# EAGLE design proiect (EAGLE 9.6.2)
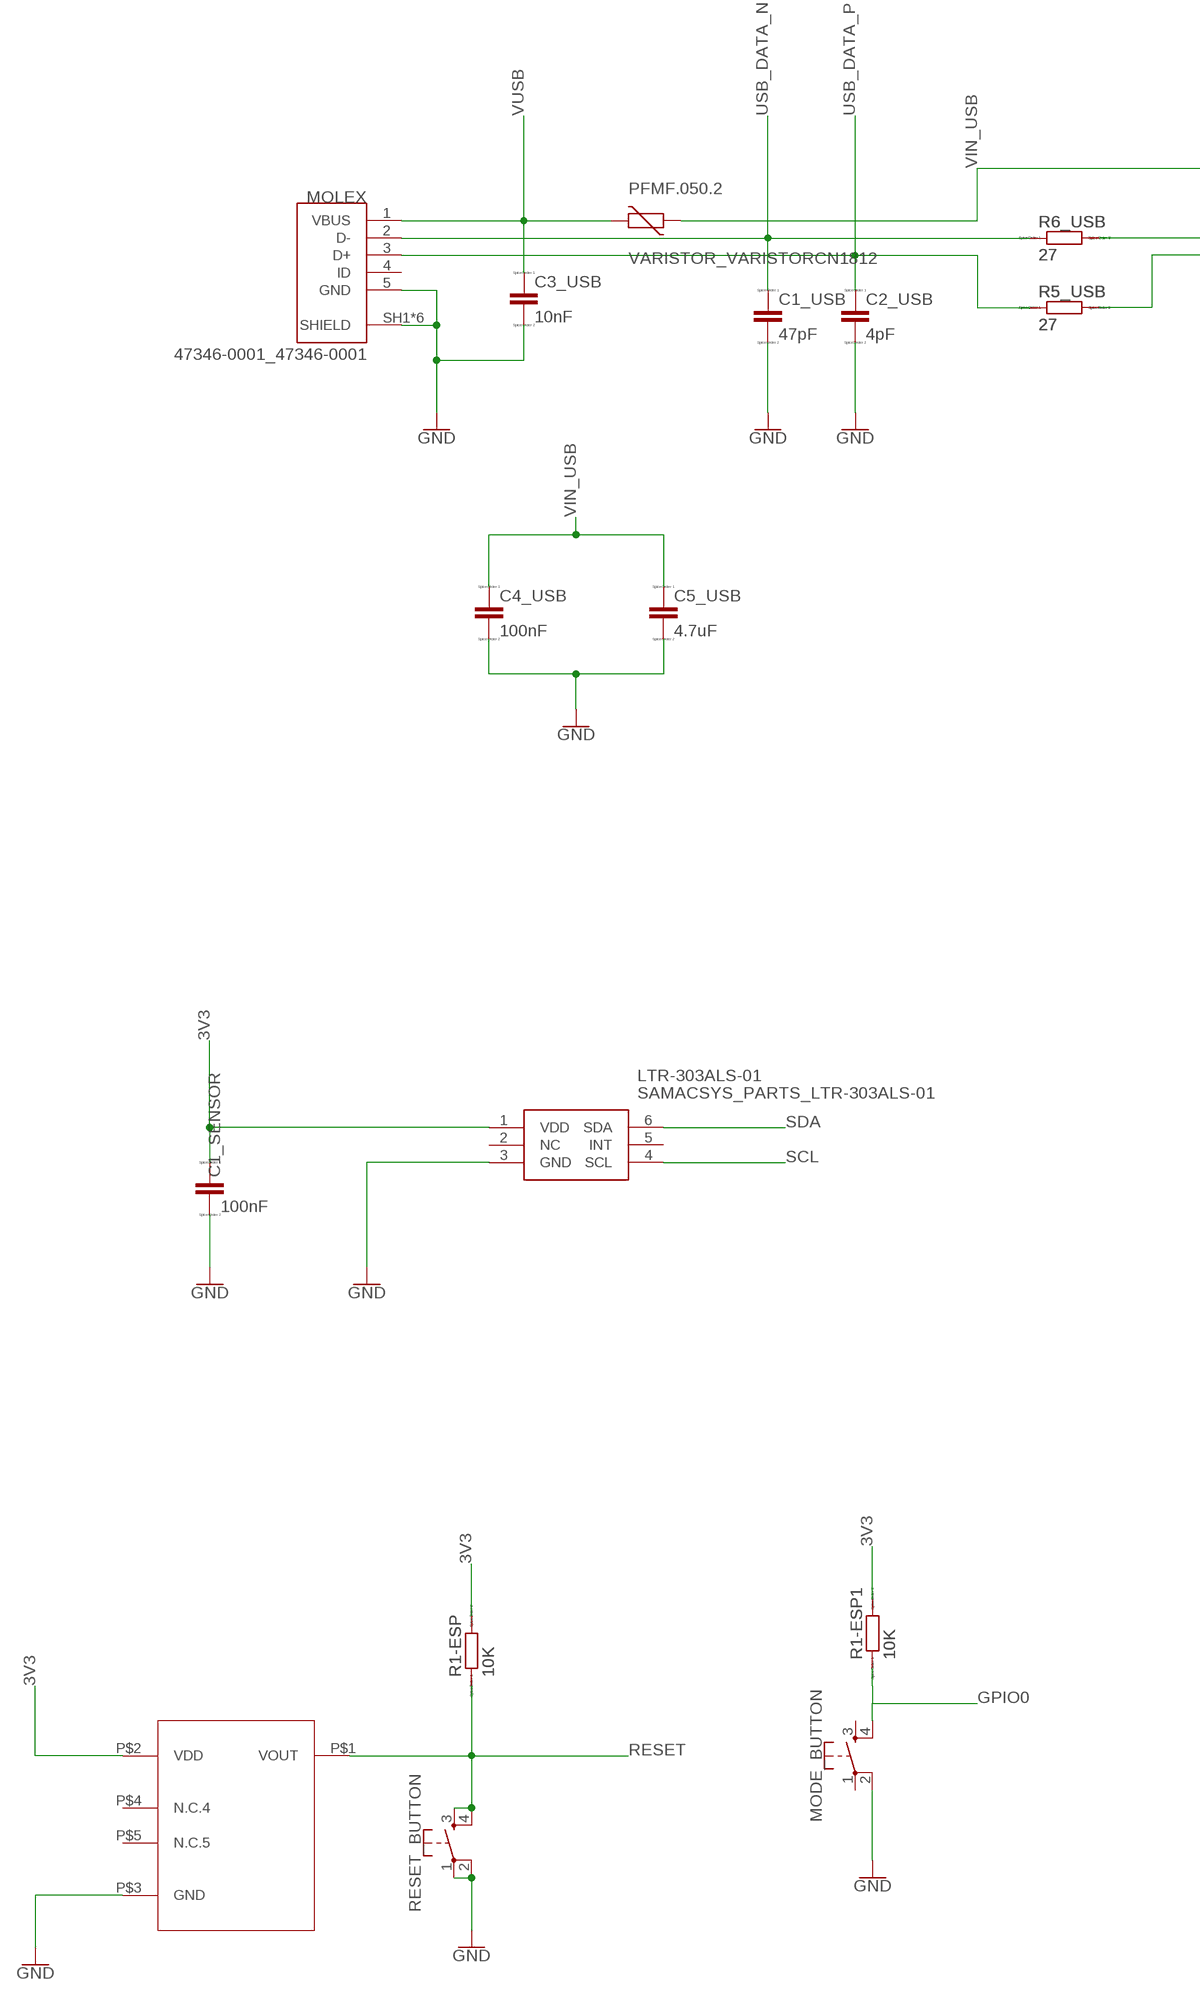
[diagram p0: schematic, sheet 1, part 1 of 2]
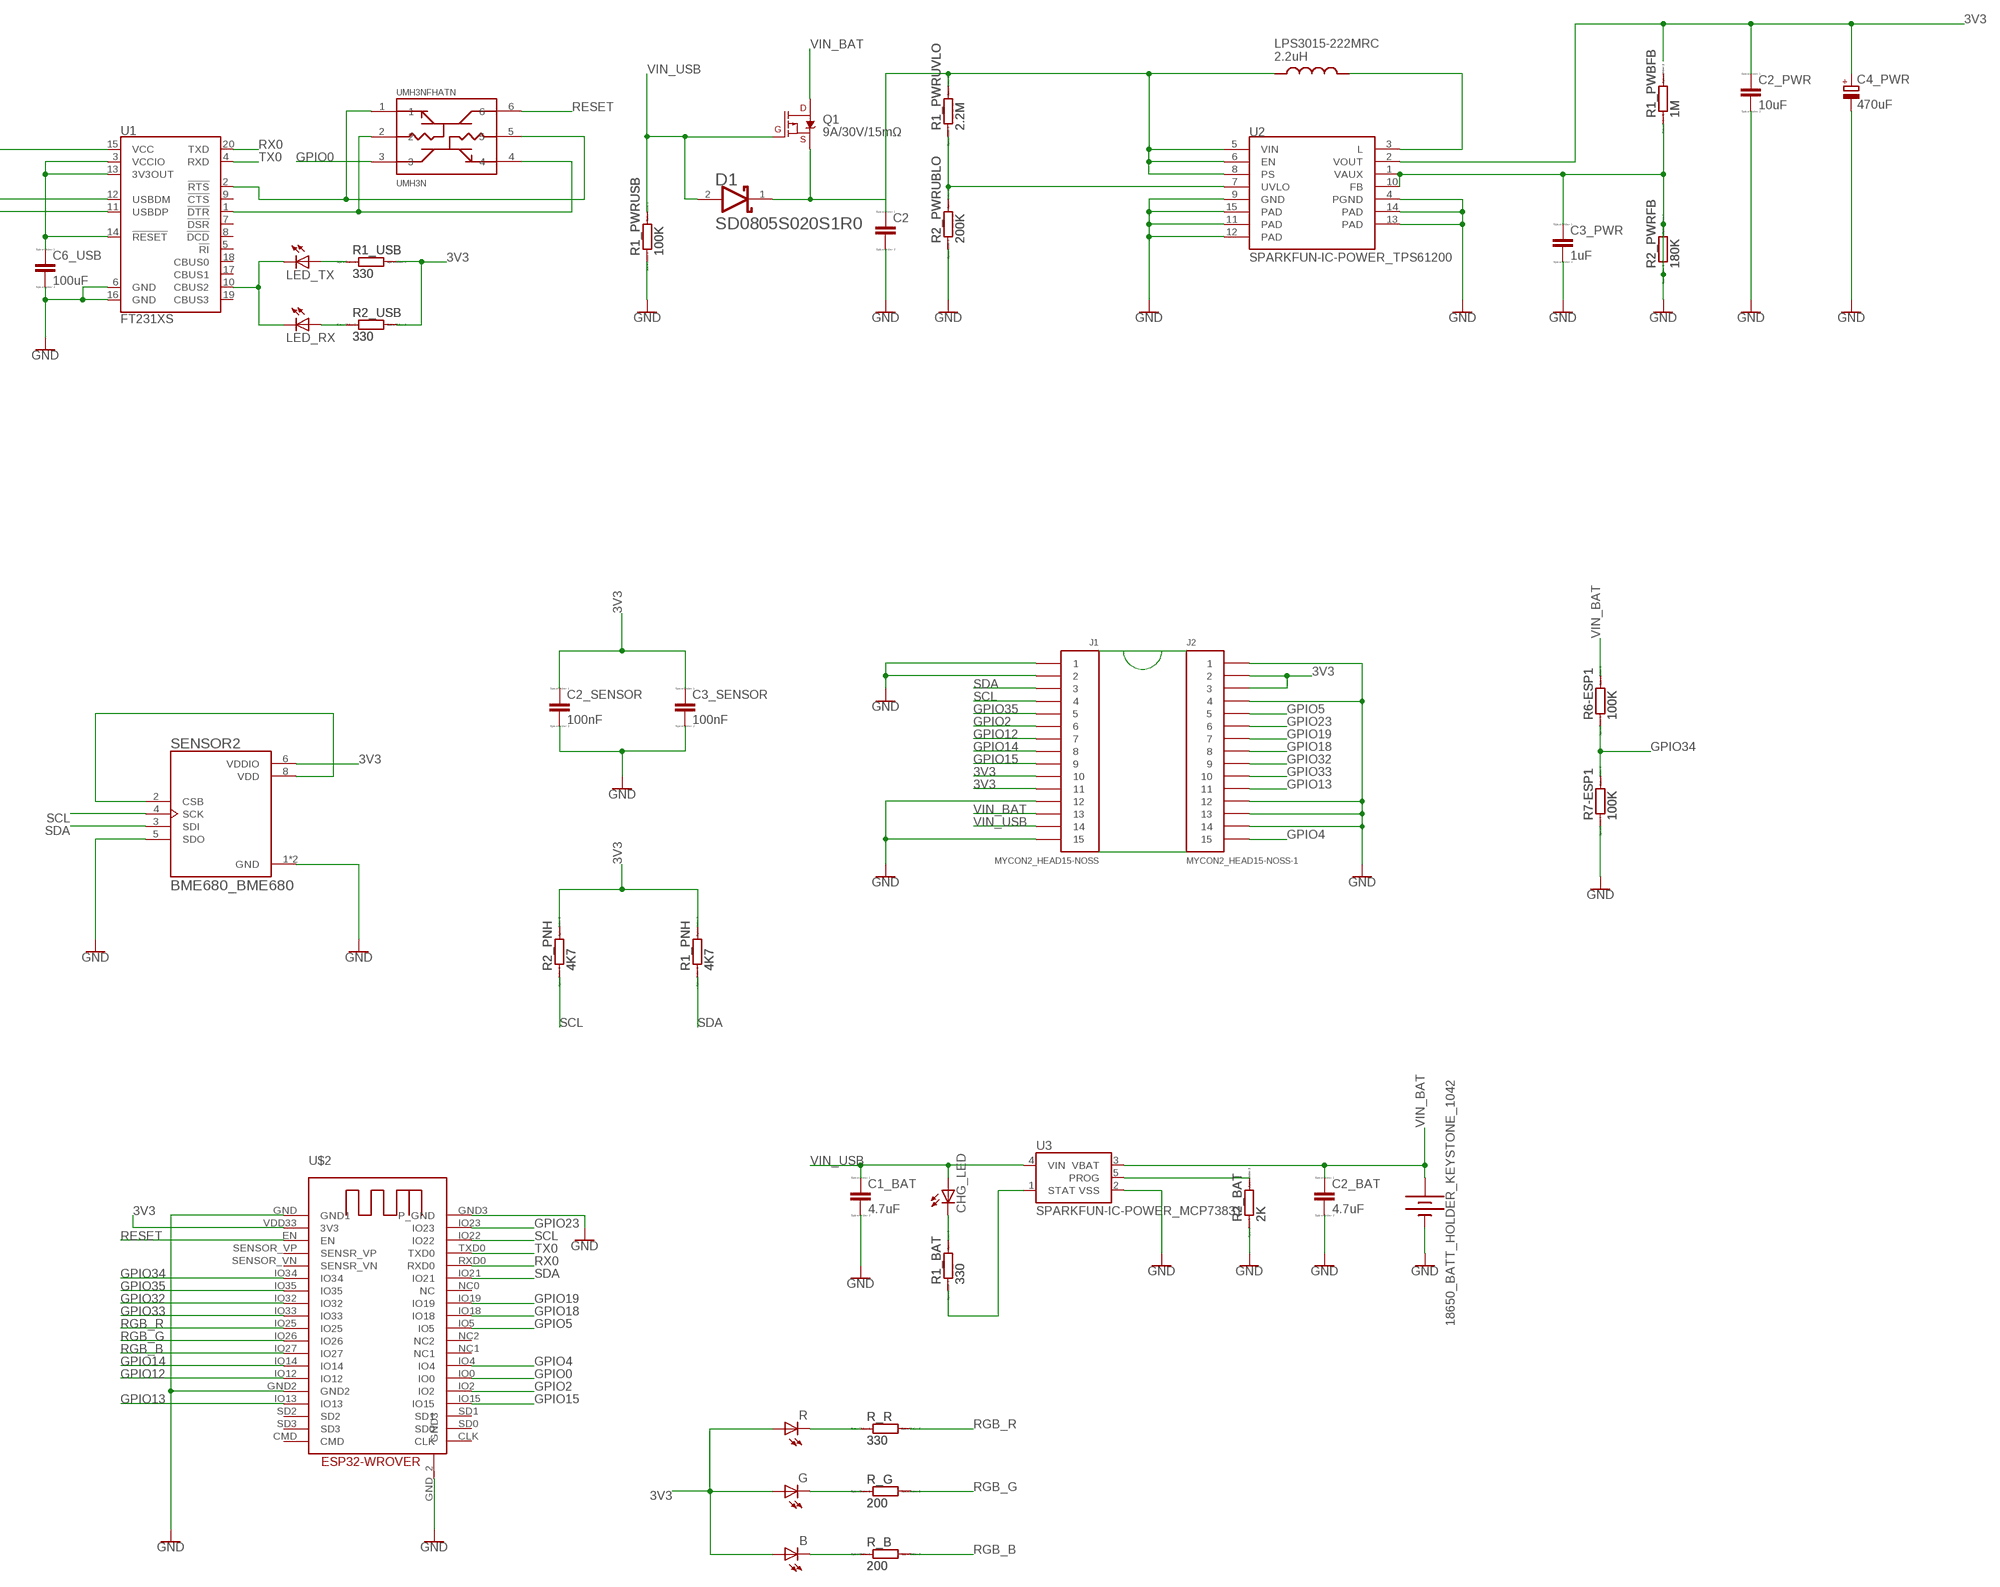
[diagram p1: schematic, sheet 1, part 2 of 2]

## Parts
18650_BATT_HOLDER_KEYSTONE_1042  BATTERY-18650  [BATTERY_18650-HOLDER]
B  ADAFRUIT_LEDCHIP-LED0603  [ADAFRUIT_CHIP-LED0603]
C1_BAT  4.7uF  EAGLE-LTSPICE_CC0402  [EAGLE-LTSPICE_C0402]
C1_SENSOR  100nF  EAGLE-LTSPICE_CC0402  [EAGLE-LTSPICE_C0402]
C1_USB  47pF  EAGLE-LTSPICE_CC0402  [EAGLE-LTSPICE_C0402]
C2  EAGLE-LTSPICE_CC0402  [EAGLE-LTSPICE_C0402]
C2_BAT  4.7uF  EAGLE-LTSPICE_CC0402  [EAGLE-LTSPICE_C0402]
C2_PWR  10uF  EAGLE-LTSPICE_CC0402  [EAGLE-LTSPICE_C0402]
C2_SENSOR  100nF  EAGLE-LTSPICE_CC0402  [EAGLE-LTSPICE_C0402]
C2_USB  4pF  EAGLE-LTSPICE_CC0402  [EAGLE-LTSPICE_C0402]
C3_PWR  1uF  EAGLE-LTSPICE_CC0402  [EAGLE-LTSPICE_C0402]
C3_SENSOR  100nF  EAGLE-LTSPICE_CC0402  [EAGLE-LTSPICE_C0402]
C3_USB  10nF  EAGLE-LTSPICE_CC0402  [EAGLE-LTSPICE_C0402]
C4_PWR  470uF  RCL_CPOL-EUD/7343-31R  [RCL_D/7343-31R]
C4_USB  100nF  EAGLE-LTSPICE_CC0402  [EAGLE-LTSPICE_C0402]
C5_USB  4.7uF  EAGLE-LTSPICE_CC0402  [EAGLE-LTSPICE_C0402]
C6_USB  100uF  EAGLE-LTSPICE_CC0402  [EAGLE-LTSPICE_C0402]
CHG_LED  ADAFRUIT_LEDCHIP-LED0603  [ADAFRUIT_CHIP-LED0603]
D1  AVX---SD0805S020S1R0_AVX_SD0805S020S1R0AVX_SD0805S020S1R0_0_0  [AVX---SD0805S020S1R0_AVX_SD0805S020S1R0_0]
G  ADAFRUIT_LEDCHIP-LED0603  [ADAFRUIT_CHIP-LED0603]
J1  MYCON2_HEAD15-NOSS  [MYCON2_HEAD15-NOSS]
J2  MYCON2_HEAD15-NOSS-1  [MYCON2_HEAD15-NOSS-1]
LED_RX  ADAFRUIT_LEDCHIP-LED0603  [ADAFRUIT_CHIP-LED0603]
LED_TX  ADAFRUIT_LEDCHIP-LED0603  [ADAFRUIT_CHIP-LED0603]
LTR-303ALS-01  SAMACSYS_PARTS_LTR-303ALS-01  [SAMACSYS_PARTS_LTR303ALS01]
MODE_BUTTON  SPARKFUN-SWITCHES_MOMENTARY-SWITCH-SPST-2-SMD-4.6X2.8MM  [SPARKFUN-SWITCHES_TACTILE_SWITCH_SMD_4.6X2.8MM]
MOLEX  47346-0001_47346-0001  [47346-0001_MOLEX_47346-0001]
PFMF.050.2  VARISTOR_VARISTORCN1812  [VARISTOR_CT/CN1812]
Q1  9A/30V/15mΩ  SPARKFUN-DISCRETESEMI_MOSFET_PCH-SI2309DS  [SPARKFUN-DISCRETESEMI_SOT23-3]
R  ADAFRUIT_LEDCHIP-LED0603  [ADAFRUIT_CHIP-LED0603]
R1-ESP  10K  EAGLE-LTSPICE_RR0402  [EAGLE-LTSPICE_R0402]
R1-ESP1  10K  EAGLE-LTSPICE_RR0402  [EAGLE-LTSPICE_R0402]
R1_BAT  330  EAGLE-LTSPICE_RR0402  [EAGLE-LTSPICE_R0402]
R1_PNH  4K7  EAGLE-LTSPICE_RR0402  [EAGLE-LTSPICE_R0402]
R1_PWBFB  1M  EAGLE-LTSPICE_RR0402  [EAGLE-LTSPICE_R0402]
R1_PWRUSB  100K  EAGLE-LTSPICE_RR0402  [EAGLE-LTSPICE_R0402]
R1_PWRUVLO  2.2M  EAGLE-LTSPICE_RR0402  [EAGLE-LTSPICE_R0402]
R1_USB  330  EAGLE-LTSPICE_RR0402  [EAGLE-LTSPICE_R0402]
R2_BAT  2K  EAGLE-LTSPICE_RR0402  [EAGLE-LTSPICE_R0402]
R2_PNH  4K7  EAGLE-LTSPICE_RR0402  [EAGLE-LTSPICE_R0402]
R2_PWRFB  180K  EAGLE-LTSPICE_RR0402  [EAGLE-LTSPICE_R0402]
R2_PWRUBLO  200K  EAGLE-LTSPICE_RR0402  [EAGLE-LTSPICE_R0402]
R2_USB  330  EAGLE-LTSPICE_RR0402  [EAGLE-LTSPICE_R0402]
R5_USB  27  EAGLE-LTSPICE_RR0402  [EAGLE-LTSPICE_R0402]
R6-ESP1  100K  EAGLE-LTSPICE_RR0402  [EAGLE-LTSPICE_R0402]
R6_USB  27  EAGLE-LTSPICE_RR0402  [EAGLE-LTSPICE_R0402]
R7-ESP1  100K  EAGLE-LTSPICE_RR0402  [EAGLE-LTSPICE_R0402]
R_B  200  EAGLE-LTSPICE_RR0402  [EAGLE-LTSPICE_R0402]
R_G  200  EAGLE-LTSPICE_RR0402  [EAGLE-LTSPICE_R0402]
R_R  330  EAGLE-LTSPICE_RR0402  [EAGLE-LTSPICE_R0402]
RESET_BUTTON  SPARKFUN-SWITCHES_MOMENTARY-SWITCH-SPST-2-SMD-4.6X2.8MM  [SPARKFUN-SWITCHES_TACTILE_SWITCH_SMD_4.6X2.8MM]
SENSOR2  BME680_BME680  [BME680_PSON80P300X300X100-8N]
U1  FT231XS  [SSOP20_L]
U2  SPARKFUN-IC-POWER_TPS61200  [SPARKFUN-IC-POWER_QFN-10_PAD]
U3  SPARKFUN-IC-POWER_MCP73831  [SPARKFUN-IC-POWER_SOT23-5]
U$1  BD48E27G-TR_BD48E27G-TR  [BD48E27G-TR_SSOP5]
U$2  ESP32-WROVER_ESP32-WROVER  [ESP32-WROVER_ESP32-WROVER]
U$3  LPS3015_LPS3015  [LPS3015_LPS3015-222MRC]
UMH3NFHATN  UMH3N_UMH3N  [UMH3N_SOP65P210X100-6N]

## Nets
3V3: B.A C1_SENSOR.1 C2_PWR.1 C2_SENSOR.1 C3_SENSOR.1 C4_PWR.+ G.A J1.10 J1.11 J2.2 J2.3 LTR-303ALS-01.1(VDD) R1-ESP1.2 R1-ESP.2 R1_PNH.2 R1_USB.2 R2_PNH.2 R2_USB.2 R.A SENSOR2.6(VDDIO) U2.2(VOUT) U$1.P$2(VDD) U$2.VDD33(3V3)
GND: 18650_BATT_HOLDER_KEYSTONE_1042.GND@1(-) C1_BAT.2 C1_SENSOR.2 C1_USB.2 C2.2 C2_BAT.2 C2_PWR.2 C2_SENSOR.2 C2_USB.2 C3_PWR.1 C3_PWR.2 C3_SENSOR.2 C3_USB.2 C4_PWR.- C4_USB.2 C5_USB.2 C6_USB.2 J1.1 J1.2 J1.12 J1.15 J2.1 J2.4 J2.12 J2.13 J2.14 LTR-303ALS-01.3(GND) MODE_BUTTON.2 MOLEX.5(GND) MOLEX.SH1(SHIELD) MOLEX.SH2(SHIELD) MOLEX.SH3(SHIELD) MOLEX.SH4(SHIELD) MOLEX.SH5(SHIELD) MOLEX.SH6(SHIELD) R1_PWBFB.1 R1_PWRUSB.1 R2_BAT.1 R2_PWRFB.1 R2_PWRFB.2 R2_PWRUBLO.1 R7-ESP1.1 RESET_BUTTON.1 RESET_BUTTON.2 SENSOR2.1(GND) SENSOR2.5(SDO) SENSOR2.7(GND) U1.6(GND) U1.16(GND) U2.1(VAUX) U2.4(PGND) U2.9(GND) U2.10(FB) U2.11(PAD) U2.12(PAD) U2.13(PAD) U2.14(PAD) U2.15(PAD) U3.2(VSS) U$1.P$3(GND) U$2.GND2 U$2.GND3(P_GND) U$2.GND(GND1) U$2.GND_2(GND3)
GPIO0: MODE_BUTTON.4 R1-ESP1.1 U$2.IO0 UMH3NFHATN.3
GPIO2: J1.6 U$2.IO2
GPIO4: J2.15 U$2.IO4
GPIO5: J2.5 U$2.IO5
GPIO12: J1.7 U$2.IO12
GPIO13: J2.11 U$2.IO13
GPIO14: J1.8 U$2.IO14
GPIO15: J1.9 U$2.IO15
GPIO18: J2.8 U$2.IO18
GPIO19: J2.7 U$2.IO19
GPIO23: J2.6 U$2.IO23
GPIO32: J2.9 U$2.IO32
GPIO33: J2.10 U$2.IO33
GPIO34: R6-ESP1.1 R7-ESP1.2 U$2.IO34
GPIO35: J1.5 U$2.IO35
N$1: LED_RX.C LED_TX.C U1.10(CBUS2)
N$2: LED_RX.A R2_USB.1
N$3: U1.2(!RTS) UMH3NFHATN.1 UMH3NFHATN.5
N$4: LED_TX.A R1_USB.1
N$5: U1.1(!DTR) UMH3NFHATN.2 UMH3NFHATN.4
N$6: C6_USB.1 U1.3(VCCIO) U1.13(3V3OUT) U1.14(!RESET)
N$7: R6_USB.2 U1.12(USBDM)
N$8: R5_USB.2 U1.11(USBDP)
N$9: SENSOR2.2(CSB) SENSOR2.8(VDD)
N$10: U2.3(L) U$3.P$2
N$11: R1_PWRUVLO.1 R2_PWRUBLO.2 U2.7(UVLO)
N$14: R2_BAT.2 U3.5(PROG)
N$15: CHG_LED.C R1_BAT.2
N$16: R1_BAT.1 U3.1(STAT)
N$18: G.C R_G.1
N$20: R.C R_R.1
N$22: B.C R_B.1
RESET: R1-ESP.1 RESET_BUTTON.3 RESET_BUTTON.4 U$1.P$1(VOUT) U$2.EN UMH3NFHATN.6
RGB_B: R_B.2 U$2.IO27
RGB_G: R_G.2 U$2.IO26
RGB_R: R_R.2 U$2.IO25
RX0: U1.20(TXD) U$2.RXD0
SCL: J1.4 LTR-303ALS-01.4(SCL) R2_PNH.1 SENSOR2.4(SCK) U$2.IO22
SDA: J1.3 LTR-303ALS-01.6(SDA) R1_PNH.1 SENSOR2.3(SDI) U$2.IO21
TX0: U1.4(RXD) U$2.TXD0
USB_DATA_N: C1_USB.1 MOLEX.2(D-) R6_USB.1
USB_DATA_P: C2_USB.1 MOLEX.3(D+) R5_USB.1
VIN: C2.1 D1.1(CATHODE) Q1.2(S) R1_PWRUVLO.2 U2.5(VIN) U2.6(EN) U2.8(PS) U$3.P$1
VIN_BAT: 18650_BATT_HOLDER_KEYSTONE_1042.PWR@1(+) C2_BAT.1 J1.13 Q1.3(D) R6-ESP1.2 U3.3(VBAT)
VIN_USB: C1_BAT.1 C4_USB.1 C5_USB.1 CHG_LED.A D1.2(ANODE) J1.14 PFMF.050.2.1 Q1.1(G) R1_PWRUSB.2 U1.15(VCC) U3.4(VIN)
VUSB: C3_USB.1 MOLEX.1(VBUS) PFMF.050.2.2
Unconnected: LTR-303ALS-01.2(NC) LTR-303ALS-01.5(INT) MODE_BUTTON.1 MODE_BUTTON.3 MOLEX.4(ID) R1_PWBFB.2 U1.5(!RI) U1.7(!DSR) U1.8(!DCD) U1.9(!CTS) U1.17(CBUS1) U1.18(CBUS0) U1.19(CBUS3) U$1.P$4(N.C.4) U$1.P$5(N.C.5) U$2.CLK U$2.CMD U$2.NC0(NC) U$2.NC1 U$2.NC2 U$2.SD0 U$2.SD1 U$2.SD2 U$2.SD3 U$2.SENSOR_VN(SENSR_VN) U$2.SENSOR_VP(SENSR_VP)

## Library data of the parts
18650_BATT_HOLDER_KEYSTONE_1042 = SparkFun-Batteries:BATTERY: Battery - Single Cell A variety of battery chemistries, sizes, and footprints. Device List: 20MM_PTH - Coin Cell Battery Holder - 20mm (PTH) <https://www.sparkfun.com/products/783> 6.8MM_PTH - Coin Cell Battery Holder - 6.8MM(SMD) <https://www.digikey.com/product-detail/en/seiko-instruments/MS621FE-FL11E/728-1057-ND/1889208?WT.srch=1&gclid=CNOQ5a6LzdQCFZS2wAodXCkE0g> 12MM_SMD - Coin Cell Battery Holder - 12mm (SMD) <https://www.sparkfun.com/products/10592> 12MM_PTH - Coin Cell Battery Holder - 12mm (PTH) <https://www.sparkfun.com/products/7948> 20MM_SMD - 20mm Coin Cell Battery Holder (SMD) (2 legs) Used on the Big Time Watch Kit <https://www.sparkfun.com/products/11734> 20MM_SMD_4LEGS - Coin Cell Battery Holder - 20mm (SMD) <https://www.sparkfun.com/products/11892> 20MM_SMD_4LEGS_OVERPASTE - Coin Cell Battery Holder - 20mm (SMD) <https://www.sparkfun.com/products/11892> (Over-paste on the legs) 24.5MM_PTH - Coin Cell Battery Holder - 24.5mm (PTH) <https://www.sparkfun.com/products/8863> 9V - 9V Battery Holder - PC Mount Used on the SparkFun SparkPunk Sound Kit <https://www.sparkfun.com/products/11177> and SparkFun SparkPunk Sequencer Kit <https://www.sparkfun.com/products/12707> 18650 - Battery Holder - 18650 (PTH) <https://www.sparkfun.com/products/13113> AA - Battery Holder - 1xAA (PTH) <https://www.sparkfun.com/products/7949> AAA - Battery Holder - 1xAAA (PTH) <https://www.sparkfun.com/products/12718> AA_KIT - Battery Holder - 1xAA (PTH) <https://www.sparkfun.com/products/7949> Special kit package - pads only have exposed copper on one side of the board. AAA_KIT - Battery Holder - 1xAAA (PTH) <https://www.sparkfun.com/products/12718> Special kit package - pads only have exposed copper on one side of the board.; PROD_ID: BATT-12327; SF_SKU: PRT-13113
B CHG_LED G LED_RX LED_TX R = ESP32_WROVER:ADAFRUIT_LED: LED OSRAM: - CHIPLED LG R971, LG N971, LY N971, LG Q971, LY Q971, LO R971, LY R971 LH N974, LH R974 LS Q976, LO Q976, LY Q976 LO Q996 - Hyper CHIPLED LW Q18S LB Q993, LB Q99A, LB R99A - SideLED LS A670, LO A670, LY A670, LG A670, LP A670 LB A673, LV A673, LT A673, LW A673 LH A674 LY A675 LS A676, LA A676, LO A676, LY A676, LW A676 LS A679, LY A679, LG A679 - Hyper Micro SIDELED® LS Y876, LA Y876, LO Y876, LY Y876 LT Y87S - SmartLED LW L88C, LW L88S LB L89C, LB L89S, LG L890 LS L89K, LO L89K, LY L89K LS L896, LA L896, LO L896, LY L896 - TOPLED LS T670, LO T670, LY T670, LG T670, LP T670 LSG T670, LSP T670, LSY T670, LOP T670, LYG T670 LG T671, LOG T671, LSG T671 LB T673, LV T673, LT T673, LW T673 LH T674 LS T676, LA T676, LO T676, LY T676, LB T676, LH T676, LSB T676, LW T676 LB T67C, LV T67C, LT T67C, LS T67K, LO T67K, LY T67K, LW E67C LS E67B, LA E67B, LO E67B, LY E67B, LB E67C, LV E67C, LT E67C LW T67C LS T679, LY T679, LG T679 LS T770, LO T770, LY T770, LG T770, LP T770 LB T773, LV T773, LT T773, LW T773 LH T774 LS E675, LA E675, LY E675, LS T675 LS T776, LA T776, LO T776, LY T776, LB T776 LHGB T686 LT T68C, LB T68C - Hyper Mini TOPLED® LB M676 - Mini TOPLED Santana® LG M470 LS M47K, LO M47K, LY M47K Source: http://www.osram.convergy.de/
C1_BAT C1_SENSOR C1_USB C2 C2_BAT C2_PWR C2_SENSOR C2_USB C3_PWR C3_SENSOR C3_USB C4_USB C5_USB C6_USB = ESP32_WROVER:EAGLE-LTSPICE_C: CAPACITOR, European symbol; SPICEMODEL: NONE; SPICEPREFIX: C
C4_PWR = ESP32_WROVER:RCL_CPOL-EU: POLARIZED CAPACITOR, European symbol; SPICEPREFIX: C
D1 = ESP32_WROVER:AVX---SD0805S020S1R0_AVX_SD0805S020S1R0: Schottky Barrier Rectifier Diode; CENTROID_NOT_SPECIFIED: No; DATASHEET: http://datasheets.avx.com/schottky.pdf; DIGIKEY_DESCRIPTION: DIODE SCHOTTKY 20V 1A 0805; DIGIKEY_PART_NUMBER: 478-7800-1-ND; LEAD_FREE: yes; MF: AVX; MOUSER_PART_NUMBER: 581-SD0805S020S1R0; MPN: SD0805S020S1R0; PACKAGE: 0805 (2012 metric); PREFIX: D; ROHS: yes; TEMPERATURE_RANGE_HIGH: +125°C; TEMPERATURE_RANGE_LOW: -55°C
J1 = ESP32_WROVER:MYCON2_HEAD15-NOSS
J2 = ESP32_WROVER:MYCON2_HEAD15-NOSS-1
LTR-303ALS-01 = ESP32_WROVER:SAMACSYS_PARTS_LTR-303ALS-01: Ambient Light Sensors Ambient Light Photo Sensor Source: Datasheet <http://optoelectronics.liteon.com/upload/download/DS86-2013-0004/LTR-303ALS-01_DS_V1.pdf>; ARROW_PART_NUMBER: LTR-303ALS-01; ARROW_PRICE-STOCK: https://www.arrow.com/en/products/ltr-303als-01/lite-on-technology?region=nac; DESCRIPTION: Ambient Light Sensors Ambient Light Photo Sensor; HEIGHT: 0mm; MANUFACTURER_NAME: Lite-On; MANUFACTURER_PART_NUMBER: LTR-303ALS-01; MOUSER_PART_NUMBER: 859-LTR-303ALS-01; MOUSER_PRICE-STOCK: https://www.mouser.co.uk/ProductDetail/Lite-On/LTR-303ALS-01?qs=Ml%2FaxAEbwm%252Bm%252BetMkBDC8g%3D%3D
MODE_BUTTON RESET_BUTTON = ESP32_WROVER:SPARKFUN-SWITCHES_MOMENTARY-SWITCH-SPST-2: Momentary Switch (Pushbutton) - SPST - Two Circuits Normally-open (NO) SPST momentary switches (buttons, pushbuttons). Schematic symbol includes two switch circuits. Variants SMD-4.6MMX2.8MM - 4.60mm x 2.80mm Tactile Momentary Button Switch - Used on SparkFun SAMD21 Mini Breakout <https://www.sparkfun.com/products/13664> SMD-5.2MM - Mini Pushbutton Switch - SMD <https://www.sparkfun.com/products/8720> - Used on Arduino Pro Mini <https://www.sparkfun.com/products/11114>; PROD_ID: SWCH-14139; SF_SKU: COM-08720
MOLEX = ESP32_WROVER:47346-0001_47346-0001: CONN RCPT 5POS MICRO USB R/A SMD Check prices <https://pricing.snapeda.com/parts/47346-0001/Molex/view-part?ref=eda>; AVAILABILITY: Warning; DESCRIPTION: USB - micro B USB 2.0 Receptacle Connector 5 Position Surface Mount, Right Angle; MF: Molex; MP: 47346-0001; PACKAGE: None; PRICE: None
PFMF.050.2 = ESP32_WROVER:VARISTOR_VARISTOR: VARISTOR
Q1 = ESP32_WROVER:SPARKFUN-DISCRETESEMI_MOSFET_PCH: P-channel MOSFETs Voltage controlled devices that allow control of high current outputs. SparkFun Products: SparkFun ESP32 Thing <https://www.sparkfun.com/products/13907> SparkFun ESP8266 Thing <https://www.sparkfun.com/products/13231> SparkFun Pi Servo HAT V2 <https://www.sparkfun.com/products/15316> DMG2305UX-7 (20V/4.2A/SOT23-3); PROD_ID: TRANS-14715
R1-ESP R1-ESP1 R1_BAT R1_PNH R1_PWBFB R1_PWRUSB R1_USB R2_BAT R2_PNH R2_PWRFB R2_USB R5_USB R6-ESP1 R6_USB R7-ESP1 R_B R_G R_R = ESP32_WROVER:EAGLE-LTSPICE_R: RESISTOR, European symbol; SPICEMODEL: NONE; SPICEPREFIX: R
R1_PWRUVLO R2_PWRUBLO = ESP32_WROVER:EAGLE-LTSPICE_R*?: RESISTOR, European symbol; SPICEMODEL: NONE; SPICEPREFIX: R
SENSOR2 = ESP32_WROVER:BME680_BME680: Integrated Environmental Unit; AVAILABILITY: Unavailable; DESCRIPTION: Integrated Environmental Unit; MF: Bosch Sensortec; MP: BME680; PACKAGE: LGA-8 Bosch Tools; PRICE: None
U1 = SparkFun-IC-Comms:FT231X: FTDI FT231X Full Speed USB to Full-handshake UART This USB2.0 Full Speed IC offers a compact bridge to full handshake UART interfaces. The device is a UART, capable of operating up to 3MBaud, with low power consumption (8mA). The FT231X includes the complete FT-X series feature set and enables USB to be added into a system design quickly and easily over a UART interface. Datasheet <http://cdn.sparkfun.com/datasheets/Components/General%20IC/DS_FT231X.pdf> SparkFun Products SparkFun RedBoard - Programmed with Arduino <https://www.sparkfun.com/products/12757> (DEV-12757) SparkFun XBee Explorer USB <https://www.sparkfun.com/products/11812> (WRL-11812) SparkFun XBee Explorer Dongle <https://www.sparkfun.com/products/11697> (WRL-11697) SparkFun Blynk Board - ESP8266 <https://www.sparkfun.com/products/13794> (WRL-13794) SparkFun ESP8266 Thing - Dev Board <https://www.sparkfun.com/products/13711> (WRL-13711) SparkFun Block for Intel® Edison - Base <https://www.sparkfun.com/products/13045> (DEV-13045) SparkFun RedStick <https://www.sparkfun.com/products/13741> (DEV-13741) SparkFun Beefy 3 - FTDI Basic Breakout <https://www.sparkfun.com/products/13746> (DEV-13746) SparkFun FT231X Breakout <https://www.sparkfun.com/products/11736> (BOB-11736); PROD_ID: IC-11524
U2 = ESP32_WROVER:SPARKFUN-IC-POWER_TPS61200: DC to DC Booster IC-10035; PROD_ID: IC-10035
U3 = ESP32_WROVER:SPARKFUN-IC-POWER_MCP73831: MCP73831T Li-Ion, Li-Pol Controller Miniature single cell, fully integrated Li-Ion, Li-polymer charge management controller Datasheet <http://ww1.microchip.com/downloads/en/DeviceDoc/20001984g.pdf> SparkFun Products: SparkFun ESP32 Thing <https://www.sparkfun.com/products/13907> SparkFun 9DoF Razor IMU M0 <https://www.sparkfun.com/products/14001>; PROD_ID: IC-09995
U$1 = ESP32_WROVER:BD48E27G-TR_BD48E27G-TR
U$2 = ESP32_WROVER:ESP32-WROVER_ESP32-WROVER
U$3 = ESP32_WROVER:LPS3015_LPS3015
UMH3NFHATN = ESP32_WROVER:UMH3N_UMH3N: Dual PNP/NPN transistor for chip reset; AVAILABILITY: Unavailable; DESCRIPTION: Pre-Biased Bipolar Transistor (BJT) 2 NPN - Pre-Biased (Dual) 50V 100mA 250MHz 150mW Surface Mount UMT6; MF: Rohm; MP: UMH3N; PACKAGE: SOT-363 Rohm; PRICE: None

## Board
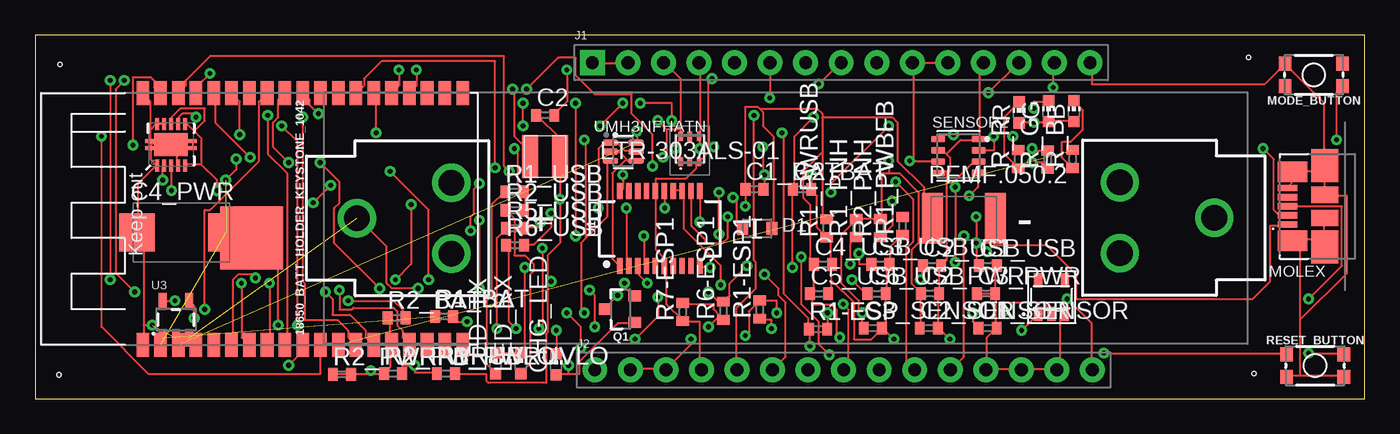
[diagram p2: board, top side]
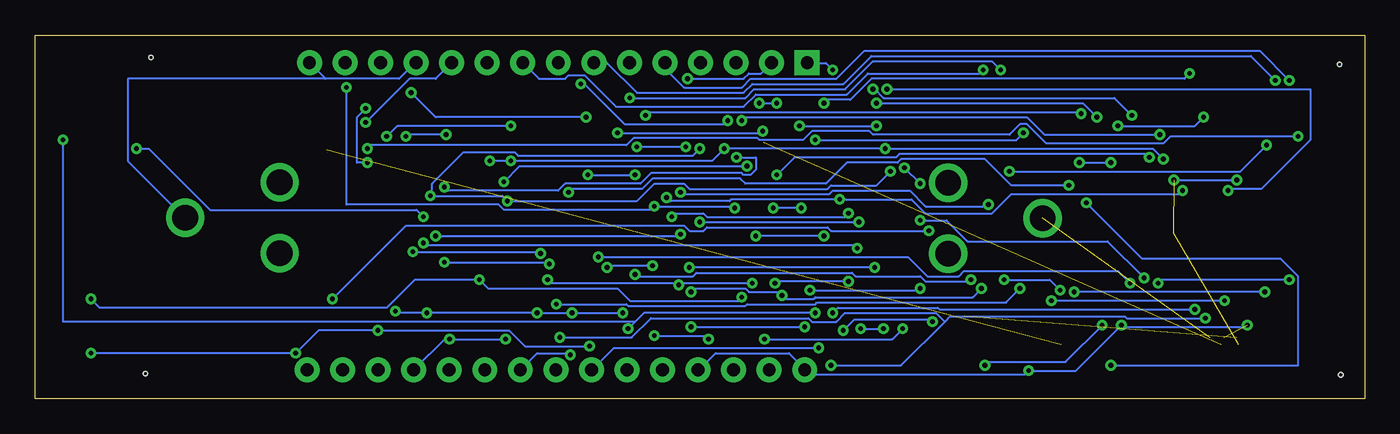
[diagram p3: board, bottom side, seen from below]

Size 95 x 26 mm. Coordinates in mm from the lower left corner, seen from the top.
Outline: 0,0 95,0 95,26 0,26 0,0
Copper layers (1*16): Top 0.035mm / dielectric 1.5mm / Bottom 0.035mm
Design rules "default": minimum track width 6mil, minimum drill 0.35mm, track to track 6mil, track to pad 6mil, pad to pad 6mil, via to via 6mil, smd to smd 6mil, copper to edge 40mil, drill to drill 6mil, minimum pad ring 10mil, minimum via ring 8mil, stop-mask expansion 4mil, vias tented up to drill 0mil, thermal gap 10mil
Holes 0.3 mm at 86.7,24.4 87.1,1.8 1.8,23.9 1.7,1.7

### Footprints (pad centres in the part's own frame; a part is rotated, then mirrored left to right if it is on the bottom)
BATTERY_18650-HOLDER = drill 1.829: GND@1 30.628,0.01; GND@2 23.88,2.55; GND@3 23.88,-2.53; PWR@1 -30.628,-0.01; PWR@2 -23.88,2.53; PWR@3 -23.88,-2.55
ADAFRUIT_CHIP-LED0603 = smd 0.8 x 0.8: A 0,-0.75; C 0,0.75
EAGLE-LTSPICE_C0402 = smd 0.7 x 0.9: 1 -0.65,0; 2 0.65,0
RCL_D/7343-31R = smd 2.55 x 2.7: + 3.175,0; - -3.175,0
AVX---SD0805S020S1R0_AVX_SD0805S020S1R0_0 = smd 0.8 x 0.9: 1 -1.05,0; 2 1.05,0
MYCON2_HEAD15-NOSS = drill 0.914 pad 1.778 square: 1 0,0 | drill 0.914 pad 1.778: 2 2.54,0; 3 5.08,0; 4 7.62,0; 5 10.16,0; 6 12.7,0; 7 15.24,0; 8 17.78,0; 9 20.32,0; 10 22.86,0; 11 25.4,0; 12 27.94,0; 13 30.48,0; 14 33.02,0; 15 35.56,0
MYCON2_HEAD15-NOSS-1 = drill 0.914 pad 1.778: 1 0,0; 2 2.54,0; 3 5.08,0; 4 7.62,0; 5 10.16,0; 6 12.7,0; 7 15.24,0; 8 17.78,0; 9 20.32,0; 10 22.86,0; 11 25.4,0; 12 27.94,0; 13 30.48,0; 14 33.02,0; 15 35.56,0
SAMACSYS_PARTS_LTR303ALS01 = smd 0.3 x 0.65: 1 -0.65,-0.9; 2 0,-0.9; 3 0.65,-0.9; 4 0.65,0.9; 5 0,0.9; 6 -0.65,0.9
SPARKFUN-SWITCHES_TACTILE_SWITCH_SMD_4.6X2.8MM = smd 0.9 x 1: 1 -2.05,-0.8; 2 2.05,-0.8; 3 2.05,0.8; 4 -2.05,0.8
47346-0001_MOLEX_47346-0001 = smd 0.45 x 1.38: 1 -1.3,2.66; 2 -0.65,2.66; 3 0,2.66; 4 0.65,2.66; 5 1.3,2.66 | smd 1.475 x 2.1: SH1 -2.462,2.3; SH2 2.462,2.3 | smd 2.375 x 1.9: SH3 -2.913,0; SH6 2.913,0 | smd 1.175 x 1.9: SH4 -0.838,0; SH5 0.838,0
VARISTOR_CT/CN1812 = smd 1.5 x 3.6: 1 -2.25,0; 2 2.25,0
SPARKFUN-DISCRETESEMI_SOT23-3 = smd 0.8 x 0.9: 1 -0.95,-1; 2 0.95,-1; 3 0,1.1
EAGLE-LTSPICE_R0402 = smd 0.7 x 0.9: 1 -0.65,0; 2 0.65,0
BME680_PSON80P300X300X100-8N = smd 1.016 x 0.5: 1 1.458,1.2; 2 1.458,0.4; 3 1.458,-0.4; 4 1.458,-1.2; 5 -1.458,-1.22; 6 -1.458,-0.4; 7 -1.458,0.4; 8 -1.458,1.2
SSOP20_L = smd 0.381 x 1.143: 1 -2.857,-2.68; 2 -2.223,-2.68; 3 -1.587,-2.68; 4 -0.953,-2.68; 5 -0.318,-2.68; 6 0.318,-2.68; 7 0.953,-2.68; 8 1.587,-2.68; 9 2.223,-2.68; 10 2.857,-2.68; 11 2.857,2.68; 12 2.223,2.68; 13 1.587,2.68; 14 0.953,2.68; 15 0.318,2.68; 16 -0.318,2.68; 17 -0.953,2.68; 18 -1.587,2.68; 19 -2.223,2.68; 20 -2.857,2.68
SPARKFUN-IC-POWER_QFN-10_PAD = smd 0.297 x 0.85: 1 -1,-1.475; 2 -0.5,-1.475; 3 0,-1.475; 4 0.5,-1.475; 5 1,-1.475; 6 1,1.475; 7 0.5,1.475; 8 0,1.475; 9 -0.5,1.475; 10 -1,1.475 | smd 0.7 x 0.28: 11 -1.5,0.25; 12 -1.5,-0.25; 13 1.5,0.25; 14 1.5,-0.25 | smd 2.4 x 1.65: 15 0,0
SPARKFUN-IC-POWER_SOT23-5 = smd 0.55 x 1.2: 1 -0.95,-1.3; 2 0,-1.3; 3 0.95,-1.3; 4 0.95,1.3; 5 -0.95,1.3
BD48E27G-TR_SSOP5 = smd 0.6 x 1: P$1 -0.95,-0.8; P$2 0,-0.8; P$3 0.95,-0.8; P$4 0.95,1.6; P$5 -0.95,1.6
ESP32-WROVER_ESP32-WROVER = smd 1.7 x 0.9: CLK 18,1.27; CMD 0,1.27; EN 0,21.59; GND 0,24.13; GND3 18,24.13; GND_2 0,6.35; IO0 18,7.62; IO2 18,6.35; IO4 18,8.89; IO5 18,12.7; IO12 0,7.62; IO13 0,5.08; IO14 0,8.89; IO15 18,5.08; IO18 18,13.97; IO19 18,15.24; IO21 18,17.78; IO22 18,21.59; IO23 18,22.86; IO25 0,12.7; IO26 0,11.43; IO27 0,10.16; IO32 0,15.24; IO33 0,13.97; IO34 0,17.78; IO35 0,16.51; NC0 18,16.51; NC1 18,10.16; NC2 18,11.43; RXD0 18,19.05; SD0 18,2.54; SD1 18,3.81; SD2 0,3.81; SD3 0,2.54; SENSOR_VN 0,19.05; SENSOR_VP 0,20.32; TXD0 18,20.32; VDD33 0,22.86 | smd 4.5 x 4.5: GND2 7.62,16.34
LPS3015_LPS3015-222MRC = smd 1.14 x 3.05: P$1 1.075,-0.025; P$2 -1.075,-0.025
UMH3N_SOP65P210X100-6N = smd 1.09 x 0.4: 1 -0.92,0.65; 2 -0.92,0; 3 -0.92,-0.65; 4 0.92,-0.65; 5 0.92,0; 6 0.92,0.65

### Placement (x,y rotation side)
18650_BATT_HOLDER_KEYSTONE_1042  53.64,12.91 0 top
B  74.24,20.56 0 top
C1_BAT  51.41,14.97 0 top
C1_SENSOR  68.07,5.03 0 top
C1_USB  68.09,9.49 0 top
C2  36.46,20.26 0 top
C2_BAT  54.82,14.97 0 top
C2_PWR  63.95,7.51 0 top
C2_SENSOR  63.87,5.03 0 top
C2_USB  64.1,9.49 0 top
C3_PWR  67.96,7.51 0 top
C3_SENSOR  59.87,5.03 0 top
C3_USB  60.41,9.59 0 top
C4_PWR  10.47,11.88 0 top
C4_USB  56.32,9.59 0 top
C5_USB  56.03,7.49 0 top
C6_USB  60.14,7.49 0 top
CHG_LED  37.23,2.44 0 top
D1  51.6,12.16 0 top
G  72.43,20.56 0 top
J1  39.83,24.03 0 top
J2  40,2.05 0 top
LED_RX  34.72,2.54 0 top
LED_TX  32.91,2.54 0 top
LTR-303ALS-01  46.79,17.85 0 top
MODE_BUTTON  91.38,23.15 180 top
MOLEX  92.16,13.75 90 top
PFMF.050.2  66.36,12.88 0 top
Q1  41.85,6.39 90 top
R  70.32,20.46 0 top
R1-ESP  55.95,4.97 0 top
R1-ESP1  51.79,6.37 90 top
R1_BAT  29.23,5.87 0 top
R1_PNH  58.69,12.2 90 top
R1_PWBFB  61.99,12.34 90 top
R1_PWRUSB  56.57,12.17 90 top
R1_PWRUVLO  29.36,1.78 0 top
R1_USB  34.25,14.79 0 top
R2_BAT  25.84,5.77 0 top
R2_PNH  60.41,12.18 90 top
R2_PWRFB  21.94,1.73 0 top
R2_PWRUBLO  25.59,1.78 0 top
R2_USB  34.28,13.47 0 top
R5_USB  34.29,12.17 0 top
R6-ESP1  49.19,6.28 90 top
R6_USB  34.3,10.97 0 top
R7-ESP1  46.29,6.19 90 top
R_B  74.15,17.13 90 top
R_G  72.35,17.09 90 top
R_R  70.25,17.11 90 top
RESET_BUTTON  91.47,2.35 0 top
SENSOR2  65.98,17.35 0 top
U1  44.65,12.15 0 top
U2  9.72,18.15 0 top
U3  10.07,5.65 0 top
U$1  72.64,6.85 0 top
U$2  31.83,3.85 90 top
U$3  36.45,17.33 0 top
UMH3NFHATN  42.03,17.65 0 top

### Tracks (layer width: path | path; a pad name or v marks a point on that pad's centre or on a via)
3V3  (via drill 0.35)  (2 unrouted)
  Top 0.152: J2.2 42.62,2.12 45,2.12 J2.3 45.12,2.12 46.88,3.88 v46.88,4.25 | C2_SENSOR.1 63.25,5.12 63.25,7.5 C2_PWR.1 63.25,7.62 62.62,8.25 62.62,10.62 63.12,11.12 63.12,14.75 61.75,16.12 61,16.12 | v56.62,6.12 56.62,5 R1-ESP.2 | C3_SENSOR.1 59.12,5.12 v59.12,6.12 58.88,6.38 58.88,7 57.62,8.25 57.62,11.75 58.62,12.75 R1_PNH.2 58.75,12.88 60.38,12.88 R2_PNH.2 60.5,12.88 60.5,16.12 61,16.12 | v53,6.12 53,7 51.88,7 R1-ESP1.2 51.75,7 51,6.25 51,4.75 v50.75,4.5 | v67,6.12 67,5.5 67.38,5.12 C1_SENSOR.1 | v69.25,6.25 69.25,6.88 72,6.88 72.25,6.62 72.25,6.5 72.62,6.12 U$1.P$2 | 62.75,17 64.5,17 SENSOR2.6 | 62.75,24 62.75,17 | R.A 70.38,19.75 v71.38,19.75 72.38,19.75 G.A 72.5,19.88 74.12,19.88 B.A | 62.75,24 65.12,24 J1.11 | 62.75,24 J1.10 | v45.75,17.88 45.75,17.38 46.12,17 LTR-303ALS-01.1 | v34.25,17.88 34.5,17.62 34.5,15.25 34.88,14.88 R1_USB.2 35,14.75 35,13.5 R2_USB.2 | v9.12,15.62 9.12,16.62 U2.2 | v13.62,15.62 14.38,16.38 v14.38,17.12 | v62.5,17 62.75,17 | v61,17 61,16.12
  Bottom 0.152: v53,6.12 v56.62,6.12 v59.12,6.12 v67,6.12 69.12,6.12 v69.25,6.25 | v46.88,4.25 47.12,4.5 v50.75,4.5 | v71.38,19.75 68.25,22.88 66.38,22.88 65.25,24 J1.11 | v13.62,15.62 v9.12,15.62 | v14.38,17.12 15.12,17.88 v34.25,17.88 v45.75,17.88 46.62,17 v61,17 v62.5,17
GND  (via drill 0.35)  (1 unrouted)
  Top 0.152: MOLEX.5 89.5,15.12 89.75,15.38 89.75,16.12 MOLEX.SH2 89.88,16.25 92.12,16.25 | MOLEX.SH6 92.12,16.75 92.12,21.12 89.38,23.88 MODE_BUTTON.2 89.25,23.88 87.88,22.5 75.5,22.5 75.5,24 J1.15 | 92.12,16.25 92.12,16.62 MOLEX.SH6 | 92.12,16.25 92.12,14.62 MOLEX.SH5 92.25,14.5 93.75,14.5 93.75,9 90.38,5.62 | 92.12,16.25 MOLEX.SH6 | 90.38,1.62 93.5,1.62 RESET_BUTTON.2 | 90.38,1.62 89.5,1.62 RESET_BUTTON.1 | 92.12,11.38 92.12,10.88 MOLEX.SH3 92.12,11.38 | 92.12,11.38 92.12,12.88 MOLEX.SH4 | 92.12,11.38 90.38,11.38 | 90.38,11.38 89.88,11.38 MOLEX.SH1 90.38,11.38 | 90.38,11.38 90.38,5.62 | 90.38,5.62 90.38,1.62 | C3_SENSOR.2 60.62,5.12 60.75,5.25 60.75,7.38 C6_USB.2 60.88,7.5 60.88,9.38 61,9.5 C3_USB.2 61.12,9.62 61.12,10.88 61.88,11.62 R1_PWBFB.1 | v55.5,16 55.5,15 C2_BAT.2 55.5,14.88 55.88,14.5 55.88,12.25 56.5,11.62 R1_PWRUSB.1 56.62,11.5 56.88,11.25 56.88,9.62 C4_USB.2 56.88,9.5 56.88,8.5 | C1_BAT.2 52.12,15 v52.12,16 52,16.12 v52,18 | 56.88,8.5 56.88,7.62 56.75,7.5 C5_USB.2 | 56.88,8.5 58.5,6.88 58.5,4.25 59.75,4.25 60.5,5 C3_SENSOR.2 | U$1.P$3 73.5,6 73.25,5.75 73.25,2.25 73.12,2.12 J2.14 73,2.12 70.5,2.12 J2.13 70.38,2.12 68,2.12 | C3_PWR.1 67.38,7.5 68.5,7.5 C3_PWR.2 | C3_PWR.2 68.62,7.5 68.62,5.12 C1_SENSOR.2 68.62,5 68,4.38 68,2.12 | C1_USB.2 68.62,9.38 68.62,7.62 C3_PWR.2 | 68,2.12 J2.12 | 65.12,16.25 65.38,16.25 65.38,17.25 65.12,17.5 | 65.12,16.25 64.62,16.25 SENSOR2.5 | 65.12,17.5 64.88,17.75 SENSOR2.7 | 65.12,17.5 66.12,18.5 67.38,18.5 SENSOR2.1 67.5,18.62 67.5,23.75 67.75,24 J1.12 | 65.12,16.25 65.12,9.88 C2_USB.2 64.75,9.38 64.62,9.25 64.62,7.62 C2_PWR.2 64.5,7.5 64.5,5.12 C2_SENSOR.2 64.62,5 v65.38,4.25
  Top 0.152: v61.38,4.25 60.62,5 C3_SENSOR.2 | U2.13 11.25,18.38 11.25,18 U2.14 11.12,17.88 10,17.88 | 10,17.88 9.75,18.12 U2.15 | 10,17.88 10.12,17.75 10.12,16.75 U2.4 | 10,17.88 U2.15 | U2.9 U2.10 8.62,19.62 8.25,19.25 | 8.25,18.25 8.25,18.38 U2.11 8.25,18.5 8.25,19.25 | 8.25,18.25 8.25,18 U2.12 8.25,17.88 8.25,17.12 8.62,16.75 U2.1 8.62,16.62 7.38,15.38 7.38,12 C4_PWR.- 7.38,11.88 7.75,11.5 7.75,5.25 | 8.25,19.25 8.25,21.25 7.75,21.75 U$2.GND3 | 8.25,18.25 9.62,18.25 U2.15 | 7.75,5.25 7.75,3.88 U$2.GND | v38,23.5 38,21.25 37.12,20.38 C2.2 | J1.2 42.25,24 39.88,24 J1.1 | R2_PWRFB.1 21.38,1.75 22.5,1.75 R2_PWRFB.2 22.62,1.75 24,1.75 | R2_BAT.1 25.25,5.75 25.38,5.62 25.38,3.88 U$2.GND_2 25.38,3.75 25.38,2.25 25,1.88 R2_PWRUBLO.1 24.88,1.75 24,1.75 | J2.4 47.5,2.12 47.5,5.5 46.38,5.5 R7-ESP1.1 46.25,5.62 45.12,6.75 45.12,9.25 45,9.38 U1.6 44.88,9.5 44.88,10.12 44.38,10.62 44.38,14.75 U1.16 44.38,14.88 44.38,15.75 46.5,15.75 47.25,16.5 47.25,16.75 47.38,16.88 LTR-303ALS-01.3 47.5,17 48.12,17.62 48.12,18 | v24,2 24,1.75 | v17.38,5.25 17.38,9.5 15.5,11.38 U$2.GND2 | v48.38,22.88 48.12,22.62 48.12,18 | v8.38,5.25 7.75,5.25 | 48.12,18 v48.5,18
  Bottom 0.152: v55.5,16 v52.12,16 | 74.25,22.88 75.38,24 J1.15 | 74.25,22.88 69,22.88 67.88,24 J1.12 | 74.25,22.88 88.38,22.88 88.38,17 84.38,13 18650_BATT_HOLDER_KEYSTONE_1042.GND@1 | J2.12 67.88,2.12 65.75,4.25 v65.38,4.25 v61.38,4.25 | v38,23.5 38.5,24 39.75,24 J1.1 | J2.4 47.5,2.12 46.38,3.25 41.12,3.25 40,2.12 J2.1 40,2 39.75,1.75 24.25,1.75 v24,2 20.62,2 17.5,5.12 | v48.38,22.88 44.38,22.88 44,23.25 43.12,23.25 42.38,24 J1.2 | v8.38,5.25 8.5,5.12 17.5,5.12 | 17.5,5.12 v17.38,5.25 | v48.5,18 v52,18
GPIO0  (via drill 0.35)
  Top 0.152: v52.62,5 52.62,5.62 51.88,5.62 R1-ESP1.1 | v39.25,6.12 39,6.38 39,11.12 39.38,11.5 | 39.38,11.5 40.88,13 40.88,16.88 41,17 UMH3NFHATN.3 | v93,18.5 93,21.88 93.38,22.25 MODE_BUTTON.4 | v24.38,19 24.38,21.62 24.25,21.75 U$2.IO0 | v39.25,18.5 39.38,18.38 39.38,11.5
  Bottom 0.152: 52.12,5.5 51.5,6.12 v39.25,6.12 | 52.12,5.5 v52.62,5 | v93,18.5 93,5.5 52.12,5.5 | v24.38,19 24.88,18.5 v39.25,18.5
GPIO2  (via drill 0.35)
  Top 0.152: v26,23.5 26,22.38 25.5,21.88 U$2.IO2 | v52.5,21.5 52.5,24 J1.6
  Bottom 0.152: v26,23.5 26.62,24.12 35.12,24.12 37.12,22.12 43.62,22.12 44.25,21.5 v52.5,21.5
GPIO4  (via drill 0.35)
  Top 0.152: v32.88,16.5 32.88,24.12 24.75,24.12 23.5,22.88 23.5,22.38 23,21.88 U$2.IO4 | v31.75,15.38 31.38,15 31.38,13.25 31.12,13 v31.12,12 | v73.75,7.12 75.5,5.38 75.5,2.12 J2.15
  Bottom 0.152: v31.75,15.38 v32.88,16.5 | v31.12,12 38.12,12 38.38,12.25 47,12.25 47.25,12 48.25,12 48.62,12.38 68.5,12.38 v73.75,7.12
GPIO5  (via drill 0.35)
  Top 0.152: v20.25,20.38 19.62,21 19.62,21.38 19.25,21.75 U$2.IO5 | v51.38,20.25 51.38,9.88 51.5,9.75 51.5,7.88 50.12,6.5 50.12,2.12 J2.5
  Bottom 0.152: v20.25,20.38 20.38,20.5 51.12,20.5 v51.38,20.25
GPIO12  (via drill 0.35)
  Top 0.152: v20.75,7.62 21.25,7.12 21.25,6 22.5,6 23.62,4.88 23.62,4.38 24.12,3.88 U$2.IO12 | v7.12,7.62 5.75,9 5.75,22.12 v6.38,22.75
  Bottom 0.152: v7.12,7.62 v20.75,7.62 | v6.38,22.75 8.12,24.5 35.25,24.5 37.25,22.5 43.75,22.5 44.38,21.88 52,21.88 54.12,24 55,24 J1.7
GPIO13  (via drill 0.35)
  Top 0.152: v21.75,7.75 21.75,6.38 22.62,6.38 22.75,6.5 25.62,6.5 25.88,6.25 25.88,5.25 26.25,4.88 26.25,4.38 26.75,3.88 U$2.IO13 | v25.75,8.5 26.88,9.62 v26.88,13.88 | v48.88,11.75 v48.88,14.75 | v66.38,11.62 66.38,3 65.5,2.12 J2.11
  Bottom 0.152: v21.75,7.75 22.5,8.5 v25.75,8.5 | v26.88,13.88 27,13.75 31.38,13.75 32.5,14.88 38,14.88 38.25,14.62 48.75,14.62 v48.88,14.75 | v48.88,11.75 49,11.62 v66.38,11.62
GPIO14  (via drill 0.35)
  Top 0.152: v19.12,20.12 19.12,8.38 19.25,8.25 19.25,5.62 21.62,5.62 22.38,4.88 22.38,4.38 22.88,3.88 U$2.IO14 | v34.88,19.5 v34.88,21.12 | v42,21.12 v40.38,19.5 | v43.25,21.12 45.5,21.12 v45.5,19.88 | v56,22.5 57.5,24 J1.8
  Bottom 0.152: v19.12,20.12 20.12,21.12 v34.88,21.12 | v40.38,19.5 v34.88,19.5 | v43.25,21.12 v42,21.12 | v45.5,19.88 45.75,19.62 52.88,19.62 55.75,22.5 v56,22.5
GPIO15  (via drill 0.35)
  Top 0.152: v27.25,23.5 27.25,22.38 26.75,21.88 U$2.IO15
  Bottom 0.152: v27.25,23.5 27.5,23.25 35.5,23.25 37,21.75 43.5,21.75 44.38,20.88 53.5,20.88 55.75,23.12 56.88,23.12 57.12,22.88 59,22.88 60.12,24 J1.9
GPIO18  (via drill 0.35)
  Top 0.152: v18.12,16.88 17,18 17,19.75 17.38,20.12 17.38,21.38 17.75,21.75 U$2.IO18 | v20.38,16.88 21.75,15.5 21.75,14 21.38,13.62 21.38,11.12 v24.62,7.88 | v57.75,6.75 58.12,6.38 58.12,2.38 57.88,2.12 J2.8
  Bottom 0.152: v20.38,16.88 v18.12,16.88 | v24.62,7.88 25.62,6.88 39.12,6.88 39.25,6.75 44.12,6.75 44.25,6.62 52.62,6.62 52.75,6.75 v57.75,6.75
GPIO19  (via drill 0.35)
  Top 0.152: v12.12,6.38 12.12,13.5 12.5,13.5 16,17 16,21.25 16.5,21.75 U$2.IO19 | v38,6.12 39,5.12 v39,3.62
  Bottom 0.152: v12.12,6.38 30.38,6.38 30.5,6.5 37.62,6.5 v38,6.12 | v39,3.62 53.62,3.62 55.12,2.12 J2.7
GPIO23  (via drill 0.35)
  Top 0.152: v7,18.12 7,23 8.25,23 8.5,22.75 8.5,22.25 8.88,21.88 U$2.IO23 | v25.38,16.25 28.12,13.5 v28.12,8.5 | v52.12,8.88 53.12,7.88 53.12,7.38 53.62,6.88 53.62,3 52.75,2.12 J2.6
  Bottom 0.152: v7,18.12 8.88,16.25 v25.38,16.25 | v28.12,8.5 28.25,8.38 31.38,8.38 31.75,8.75 36.38,8.75 36.62,9 47.75,9 48,8.75 52,8.75 v52.12,8.88
GPIO32  (via drill 0.35)
  Top 0.152: v16.75,8.25 16.75,4 16.62,3.88 U$2.IO32 | v54.75,10.12 54.75,6.75 56,5.5 56,3.88 v56.75,3.12
  Bottom 0.152: v16.75,8.25 17.62,9.12 28.62,9.12 29,8.75 31.25,8.75 32.62,10.12 v54.75,10.12 | v56.75,3.12 56.88,3.25 59.12,3.25 60.25,2.12 J2.9
GPIO33  (via drill 0.35)
  Top 0.152: v16.62,20.25 16.62,17.5 18,16.12 18,4 17.88,3.88 U$2.IO33 | v35.12,22.12 37.38,24.38 38.62,24.38 38.62,23.12 40,21.75 42.62,21.75 42.62,20.38 44.12,18.88 v44.12,16.62 | v61.5,15.5 62.75,14.25 62.75,11.25 62.25,10.75 62.25,2.62 62.75,2.12 J2.10
  Bottom 0.152: v16.62,20.25 17.88,21.5 34.38,21.5 35,22.12 v35.12,22.12 | v44.12,16.62 60.38,16.62 v61.5,15.5
GPIO34  (via drill 0.35)
  Top 0.152: 48.88,6 49.12,5.75 R6-ESP1.1 | 48.88,6 48.5,6.38 48.5,6.75 46.38,6.75 R7-ESP1.2 | v15.75,8.62 15.75,8.88 14.5,8.88 14.12,8.5 14.12,3.88 U$2.IO34 | v31.75,7.88 v31.75,12.75 | v39.62,7.75 40,7.38 v40,5.12 | v48.12,5.12 48.88,5.88 48.88,6
  Bottom 0.152: v15.75,8.62 18.38,11.25 28.38,11.25 29.88,12.75 v31.75,12.75 | v31.75,7.88 31.88,7.75 v39.62,7.75 | v48.12,5.12 v40,5.12
GPIO35  (via drill 0.35)
  Top 0.152: v14.75,8.25 14.75,4.38 15.25,3.88 U$2.IO35 | v5.38,22.75 v5.38,8.5
  Bottom 0.152: v14.75,8.25 14.5,8.5 v5.38,8.5 | v5.38,22.75 7.5,24.88 35.75,24.88 37.75,22.88 43.88,22.88 44.5,22.25 48.62,22.25 49.88,23.5 49.88,24 J1.5
N$1  (via drill 0.35)
  Top 0.152: LED_TX.C 33,3.25 34.62,3.25 LED_RX.C 34.75,3.38 35,3.62 v35,9.38 | v48.25,9.38 47.62,9.38 U1.10
  Bottom 0.152: v35,9.38 v48.25,9.38
N$2
  Top 0.152: LED_RX.A 34.75,1.88 35.38,2.5 35.38,8.88 35.62,9.12 35.62,9.62 35,10.25 34.25,10.25 34.25,12.88 33.75,13.38 R2_USB.1
N$3  (via drill 0.35)
  Top 0.152: UMH3NFHATN.5 42.88,17.75 42.12,17.75 41.62,18.25 41.12,18.25 UMH3NFHATN.1 41,18.25 40.62,18.25 40.25,17.88 v40.25,13.62 | v42.25,13.62 42.25,9.62 42.38,9.5 U1.2
  Bottom 0.152: v40.25,13.62 v42.25,13.62
N$4
  Top 0.152: LED_TX.A 32.88,1.88 32.25,2.5 32.25,7 32.62,7.38 32.62,13.88 33.5,14.75 R1_USB.1
N$5
  Top 0.152: 42.25,17.12 42.38,17 UMH3NFHATN.4 | 42.25,17.12 41.75,17.62 41.12,17.62 UMH3NFHATN.2 | 42.25,17.12 41.25,16.12 41.25,10 41.75,9.5 U1.1
N$6  (via drill 0.35)
  Top 0.152: U1.14 45.62,14.88 46.12,14.88 U1.13 46.25,14.75 46.38,14.62 46.38,12.12 49,9.5 v49,8.12 | v58.38,8.5 59.38,7.5 C6_USB.1 | v43.75,8.25 43.12,8.88 43.12,9.38 U1.3
  Bottom 0.152: v58.38,8.5 58.12,8.25 49,8.25 | v43.75,8.25 49,8.25 | 49,8.25 v49,8.12
N$7  (via drill 0.35)
  Top 0.152: v36.88,13.25 36.88,12.25 35.62,11 35,11 R6_USB.2 | v49.5,13 49.5,11.5 49.12,11.12 47.88,11.12 47.88,11.38 46.88,12.38 46.88,14.75 U1.12
  Bottom 0.152: v36.88,13.25 37.12,13 47,13 47.25,13.25 49.25,13.25 v49.5,13
N$8  (via drill 0.35)
  Top 0.152: v36.12,12.62 36.12,12.25 35,12.25 R5_USB.2 | v47.5,12.62 47.5,14.75 U1.11
  Bottom 0.152: v47.5,12.62 v36.12,12.62
N$9  (via drill 0.35)
  Top 0.152: SENSOR2.2 68.5,17.75 v68.5,18.75 | v65.62,18.88 64.62,18.88 64.62,18.62 SENSOR2.8
  Bottom 0.152: v68.5,18.75 68.38,18.88 v65.62,18.88
N$10  (via drill 0.35)
  Top 0.152: v9.75,14.88 9.75,16.62 U2.3 | v34.12,22.12 34.25,22 34.25,18.75 35.38,17.62 U$3.P$2
  Bottom 0.152: v9.75,14.88 9.62,15 7.38,15 3.88,18.5 3.88,22.12 v34.12,22.12
N$11  (via drill 0.35)
  Top 0.152: v11.5,20.12 11.5,20.38 10.5,20.38 10.25,20.12 10.25,19.62 U2.7 | v17.62,19.5 18.75,18.38 v18.75,5.25 | R2_PWRUBLO.2 26.25,1.88 26.25,2.38 v27.12,2.38 27.12,1.88 28.62,1.88 R1_PWRUVLO.1
  Bottom 0.152: v11.5,20.12 12.12,19.5 v17.62,19.5 | v18.75,5.25 21.38,2.62 26.88,2.62 v27.12,2.38
N$14  (via drill 0.35)
  Top 0.152: v22.38,7 25.62,7 26.25,6.38 26.25,6 26.38,5.88 R2_BAT.2 | v10,7 9.12,7 U3.5
  Bottom 0.152: v10,7 v22.38,7
N$15  (via drill 0.35)
  Top 0.152: v37.25,4.88 37.25,3.25 CHG_LED.C | v30.88,5.5 30,5.5 30,5.75 R1_BAT.2
  Bottom 0.152: v37.25,4.88 36.5,5.62 31,5.62 v30.88,5.5
N$16  (1 unrouted)
N$18  (via drill 0.35)
  Top 0.152: v71.38,20.75 71.38,21.25 72.38,21.25 G.C | v71.25,16.88 72.25,16.88 72.25,16.5 R_G.1
  Bottom 0.152: v71.38,20.75 72,20.12 72,16.88 v71.25,16.88
N$20
  Top 0.152: R.C 70.25,21.12 69.25,20.12 69.25,17.5 70.25,16.5 R_R.1
N$22
  Top 0.152: B.C 74.25,21.25 74.88,20.62 74.88,19.25 74,18.38 73.38,18.38 73.38,17.25 74.12,16.5 R_B.1
RESET  (via drill 0.35)  (1 unrouted)
  Top 0.152: v55.38,3.75 55.38,4.88 R1-ESP.1 55.25,5 55.25,5.75 53.5,7.5 53.5,18.88 v53.38,19 | v70.5,4.88 71.62,6 U$1.P$1 | v76.38,3.25 89.38,3.25 RESET_BUTTON.4 | v91,3.25 93.5,3.25 RESET_BUTTON.3 | v43,19.12 43,18.38 UMH3NFHATN.6
  Bottom 0.152: v55.38,3.75 60,3.75 61.12,4.88 v70.5,4.88 74.75,4.88 v76.38,3.25 v91,3.25 | v43,19.12 43.12,19 v53.38,19
RGB_B  (1 unrouted)
RGB_G  (via drill 0.35)
  Top 0.152: v71.25,17.88 71.25,17.75 72.25,17.75 R_G.2 | v4.75,18.75 4.75,5.12 8.12,1.75 20.38,1.75 20.38,3.75 U$2.IO26
  Bottom 0.152: v71.25,17.88 71,18.12 52.75,18.12 52.25,18.62 43.38,18.62 43.25,18.5 40.12,18.5 39.5,19.12 35.38,19.12 35.12,18.88 25.38,18.88 24.62,19.62 24.12,19.62 22.75,18.25 14.38,18.25 13.88,18.75 v4.75,18.75
RGB_R  (via drill 0.35)
  Top 0.152: v69.88,18.75 69.88,18.25 70.25,17.88 R_R.2 | v61,19.5 56.88,15.38 v56.88,14.75 | v19.88,14 v21.12,15.25 | v18.12,2.38 19.12,3.38 19.12,3.75 U$2.IO25
  Bottom 0.152: v69.88,18.75 69.12,19.5 v61,19.5 | v56.88,14.75 56.62,15 51.62,15 50.88,15.75 44.62,15.75 44.25,15.38 38.5,15.38 37,16.88 33.38,16.88 33.12,17.12 27.12,17.12 25.25,15.25 v21.12,15.25 | v19.88,14 15.88,10 6,10 4.75,8.75 4.75,2.38 v18.12,2.38
RX0  (via drill 0.35)
  Top 0.152: v42,16 42,15 41.88,14.88 U1.20 | v15.38,17.25 12.88,19.75 12.88,21.75 U$2.RXD0
  Bottom 0.152: v42,16 40.75,17.25 33.5,17.25 33.25,17.5 15.62,17.5 v15.38,17.25
SCL  (via drill 0.35)
  Top 0.152: 47.5,18.75 47.5,24 J1.4 | v61.25,14.12 61.25,12.38 60.5,11.62 R2_PNH.1 | v66.75,14.5 67.38,15.12 67.38,16.12 SENSOR2.4 | v33.88,16.25 33.5,16.62 33.5,24.5 12.5,24.5 10.75,22.75 10.75,22.38 10.25,21.88 U$2.IO22 | v47.5,17.88 47.5,18.75 | 47.5,18.75 LTR-303ALS-01.4
  Bottom 0.152: 66.62,14.5 61.62,14.5 v61.25,14.12 52,14.12 50.75,15.38 48.62,15.38 48.25,15 38.38,15 38.12,15.25 34.88,15.25 v33.88,16.25 | v47.5,17.88 48,17.38 60.5,17.38 60.75,17.62 64.38,17.62 66.62,15.38 66.62,14.5 | 66.62,14.5 v66.75,14.5
SDA  (via drill 0.35)
  Top 0.152: v58.25,9.62 58.25,11.12 58.62,11.5 R1_PNH.1 | v65.75,9.75 v65.75,15.12 65.75,15.62 67,16.88 67.38,16.88 SENSOR2.3 | 46.12,19.25 46.12,22.88 45,24 J1.3 | 46.12,19.25 46.12,18.75 LTR-303ALS-01.6 | v14.62,18.88 14.62,21.25 14.12,21.75 U$2.IO21 | 45.12,19.25 v44.5,19.88 | 46.12,19.25 45.12,19.25 | v44.88,17.25 45.12,17.5 45.12,19.25
  Bottom 0.152: v58.25,9.62 58.38,9.75 v65.75,9.75 | v14.62,18.88 22.88,18.88 24.12,20.12 44.25,20.12 v44.5,19.88 | v65.75,15.12 65.5,14.88 57.62,14.88 57.12,15.38 51.75,15.38 51,16.12 44.5,16.12 44.38,16 43.88,16 43.5,16.38 43.5,17.25 v44.88,17.25
TX0  (via drill 0.35)
  Top 0.152: v43.5,11.62 43.5,9.62 43.62,9.5 U1.4 | v38.62,21.12 v38.62,11.62 | v12.5,23.25 11.62,22.38 11.62,21.88 U$2.TXD0
  Bottom 0.152: v38.62,11.62 v43.5,11.62 | v38.62,21.12 38.38,21.38 36.75,21.38 35.25,22.88 12.88,22.88 v12.5,23.25
USB_DATA_N  (via drill 0.35)
  Top 0.152: v67.25,13 v67.25,11.12 67.25,9.62 67.38,9.5 C1_USB.1 | v87.75,17.88 88.5,17.12 88.5,13.5 88.88,13.12 89.5,13.12 MOLEX.2 | v34.38,5 33.88,5.5 33.88,10.75 33.75,10.88 R6_USB.1 | v36,5 36.25,5.25 v36.25,10.75
  Bottom 0.152: v67.25,13 67.75,13.5 82.5,13.5 86.88,17.88 v87.75,17.88 | v36,5 v34.38,5 | v36.25,10.75 36.5,11 67.12,11 v67.25,11.12
USB_DATA_P  (via drill 0.35)
  Top 0.152: v33,5 33,11.5 33.62,12.12 R5_USB.1 | v42.88,4.25 44.5,5.88 v44.5,7.25 | v63.25,8.5 63.38,8.62 63.38,9.38 C2_USB.1 | MOLEX.3 93.38,13.75 93.38,9.5 v91,7.12
  Bottom 0.152: v33,5 33.75,4.25 v42.88,4.25 | v44.5,7.25 44.75,7 52.5,7 53.38,7.88 62.62,7.88 v63.25,8.5 67.88,8.5 69.88,6.5 90.38,6.5 v91,7.12
VIN  (via drill 0.35)
  Top 0.152: 11.88,16.75 10.75,16.75 U2.5 | 11.88,16.75 11.88,18.62 11.38,19.12 | 11.38,19.12 10.88,19.62 U2.6 | 11.38,19.12 12.12,19.88 12.12,20.75 10.38,20.75 9.75,20.12 9.75,19.62 U2.8 | 36.62,8.38 36.62,10.25 37.5,11.12 v37.5,14.25 37.5,17.25 U$3.P$1 37.5,17.38 37.5,18.62 35.88,20.25 C2.1 | 36.62,8.38 36.62,4.75 36.5,4.62 36.5,1.12 32.38,1.12 32.25,1.25 32.25,1.75 30.12,1.75 R1_PWRUVLO.2 | v42.12,8.25 42.12,8 42.75,7.38 Q1.2 | 36.62,8.38 v36.88,8.38 | v49.88,14.38 50.12,14.12 50.12,12.62 50.5,12.25 D1.1 | 11.88,16.75 13,15.62 v13,14.88
  Bottom 0.152: v42.12,8.25 42,8.38 v36.88,8.38 | v49.88,14.38 49.62,14.12 45.38,14.12 45.25,14.25 v37.5,14.25 32.38,14.25 31.38,13.25 26.62,13.25 25.25,14.62 13.25,14.62 v13,14.88
VIN_BAT  (via drill 0.35)  (1 unrouted)
  Top 0.152: v41.62,7.38 40.75,6.5 Q1.3 | v48.12,7.62 48.75,7 49.12,7 R6-ESP1.2 49.25,7 49.62,7.38 49.62,8.25 v50.88,9.5 | v54.12,9.38 54.12,14.88 C2_BAT.1 54.25,15 54.25,18.75 v55.62,20.12 | v68.12,21.88 70.25,24 J1.13 | v27.38,7.88 25.5,7.88 25.12,8.25 25.12,10.88 23.12,12.88 18650_BATT_HOLDER_KEYSTONE_1042.PWR@1
  Bottom 0.152: v48.12,7.62 47.88,7.88 44.25,7.88 44,7.62 41.88,7.62 v41.62,7.38 41.38,7.12 39.38,7.12 39.25,7.25 28,7.25 v27.38,7.88 | v54.12,9.38 54,9.5 v50.88,9.5 | v68.12,21.88 66.38,20.12 v55.62,20.12
VIN_USB  (via drill 0.35)
  Top 0.152: 38.12,1.75 38.88,1.75 38.88,2.62 41.62,5.38 42.75,5.38 Q1.1 | 38.12,1.75 37.25,1.75 CHG_LED.A | v11.38,5.75 11.38,6.62 11.12,6.88 U3.4 | 38.12,1.75 v38.12,2.38 | 51.75,20.75 51.62,20.88 50.75,20.88 50.75,15 C1_BAT.1 50.75,14.88 v50.75,13.75 | 51.75,20.75 52,20.5 52,19.5 52.75,18.75 52.75,12.25 D1.2 | 56.25,20.12 56.25,20.38 55.88,20.75 51.75,20.75 | 56.25,20.12 56.25,17.62 | 56.25,17.62 56.25,13.12 56.5,12.88 R1_PWRUSB.2 | v45,13.62 45,14.75 U1.15 | 56.25,17.62 54.88,16.25 54.88,14.38 55.38,13.88 55.38,9.88 55.62,9.62 C4_USB.1 55.62,9.5 55.62,7.62 55.5,7.5 C5_USB.1 55.5,7.38 55.5,6.75 56.88,6.75 57.25,6.38 57.25,4.62 v57.5,4.38 | v72.75,22.25 72.75,24 J1.14 | 56.25,20.12 61.25,20.12 61.62,19.75 61.62,17 63.5,15.12 63.5,13.5 64,13 PFMF.050.2.1
  Bottom 0.152: v11.38,5.75 17,5.75 17.12,5.88 29.62,5.88 30,5.5 | 30,5.5 33.12,2.38 v38.12,2.38 | v45,13.62 45.12,13.75 v50.75,13.75 51,13.5 61.5,13.5 61.88,13.88 72.75,13.88 v72.75,22.25 | 30,5.5 30.62,6.12 37.12,6.12 37.75,5.5 39.5,5.5 39.75,5.75 51,5.75 52.38,4.38 v57.5,4.38
VUSB  (via drill 0.35)
  Top 0.152: v58.88,10.38 58.88,9.62 59.75,9.62 C3_USB.1 | 68.5,11 v68,10.5 | 68.5,11 68.5,12.88 PFMF.050.2.2 | 68.5,11 72.25,11 74.38,8.88 74.38,7.12 87,7.12 88.25,8.38 88.25,12.38 89.5,12.38 MOLEX.1
  Bottom 0.152: v58.88,10.38 59,10.5 v68,10.5